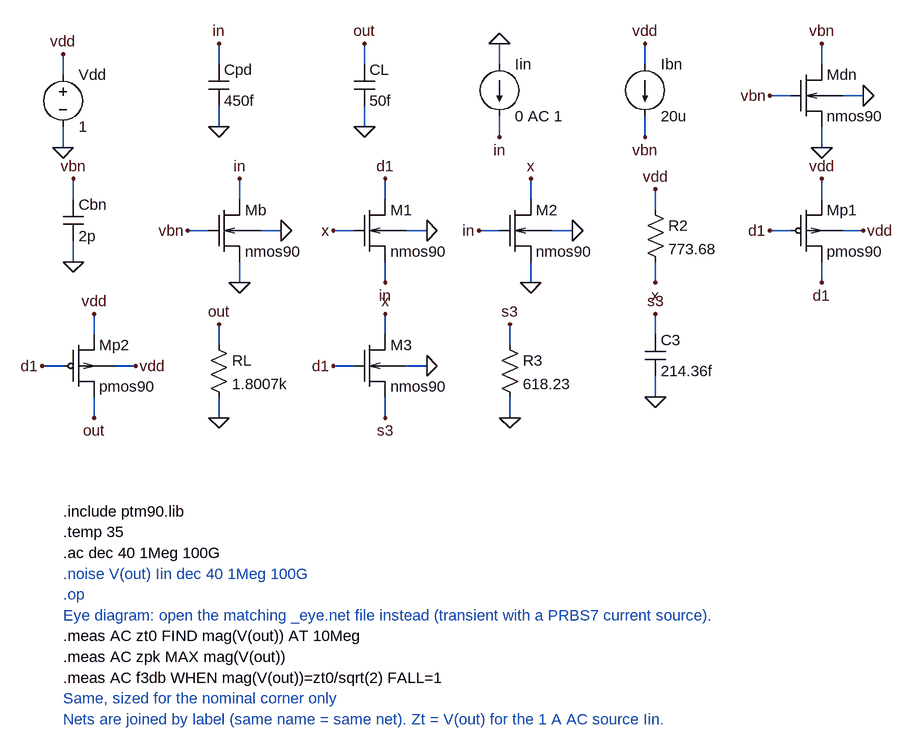
[diagram p0: schematic var_cmnrc_nominal.asc]
var_cmnrc_nominal.asc, the LTspice schematic file:
Version 4
SHEET 1 1600 1400
WIRE 0 16 0 -16
WIRE 0 96 0 128
WIRE 240 0 240 -32
WIRE 240 64 240 96
WIRE 464 0 464 -32
WIRE 464 64 464 96
WIRE 672 0 672 -32
WIRE 672 80 672 112
WIRE 896 0 896 -32
WIRE 896 80 896 112
WIRE 1168 0 1168 -32
WIRE 1120 48 1088 48
WIRE 1168 96 1168 128
WIRE 1200 48 1232 48
WIRE 16 208 16 176
WIRE 16 272 16 304
WIRE 272 208 272 176
WIRE 224 256 192 256
WIRE 272 304 272 336
WIRE 304 256 336 256
WIRE 496 208 496 176
WIRE 448 256 416 256
WIRE 496 304 496 336
WIRE 528 256 560 256
WIRE 720 208 720 176
WIRE 672 256 640 256
WIRE 720 304 720 336
WIRE 752 256 784 256
WIRE 912 224 912 192
WIRE 912 304 912 336
WIRE 1168 304 1168 336
WIRE 1120 256 1088 256
WIRE 1168 208 1168 176
WIRE 1200 256 1232 256
WIRE 48 512 48 544
WIRE 0 464 -32 464
WIRE 48 416 48 384
WIRE 80 464 112 464
WIRE 240 432 240 400
WIRE 240 512 240 544
WIRE 496 416 496 384
WIRE 448 464 416 464
WIRE 496 512 496 544
WIRE 528 464 560 464
WIRE 688 432 688 400
WIRE 688 512 688 544
WIRE 912 416 912 384
WIRE 912 480 912 512
FLAG 0 -16 vdd
FLAG 0 128 0
FLAG 240 -32 in
FLAG 240 96 0
FLAG 464 -32 out
FLAG 464 96 0
FLAG 672 -32 0
FLAG 672 112 in
FLAG 896 -32 vdd
FLAG 896 112 vbn
FLAG 1168 -32 vbn
FLAG 1088 48 vbn
FLAG 1168 128 0
FLAG 1232 48 0
FLAG 16 176 vbn
FLAG 16 304 0
FLAG 272 176 in
FLAG 192 256 vbn
FLAG 272 336 0
FLAG 336 256 0
FLAG 496 176 d1
FLAG 416 256 x
FLAG 496 336 in
FLAG 560 256 0
FLAG 720 176 x
FLAG 640 256 in
FLAG 720 336 0
FLAG 784 256 0
FLAG 912 192 vdd
FLAG 912 336 x
FLAG 1168 336 d1
FLAG 1088 256 d1
FLAG 1168 176 vdd
FLAG 1232 256 vdd
FLAG 48 544 out
FLAG -32 464 d1
FLAG 48 384 vdd
FLAG 112 464 vdd
FLAG 240 400 out
FLAG 240 544 0
FLAG 496 384 x
FLAG 416 464 d1
FLAG 496 544 s3
FLAG 560 464 0
FLAG 688 400 s3
FLAG 688 544 0
FLAG 912 384 s3
FLAG 912 512 0
SYMBOL voltage 0 0 R0
SYMATTR InstName Vdd
SYMATTR Value 1
SYMBOL cap 224 0 R0
SYMATTR InstName Cpd
SYMATTR Value 450f
SYMBOL cap 448 0 R0
SYMATTR InstName CL
SYMATTR Value 50f
SYMBOL current 672 0 R0
SYMATTR InstName Iin
SYMATTR Value 0 AC 1
SYMBOL current 896 0 R0
SYMATTR InstName Ibn
SYMATTR Value 20u
SYMBOL tia_nmos4 1120 0 R0
SYMATTR InstName Mdn
SYMATTR Value nmos90
SYMATTR Value2 l=200n w=1u ad=0.2p as=0.2p pd=2.4u ps=2.4u
SYMBOL cap 0 208 R0
SYMATTR InstName Cbn
SYMATTR Value 2p
SYMBOL tia_nmos4 224 208 R0
SYMATTR InstName Mb
SYMATTR Value nmos90
SYMATTR Value2 l=200n w=4.696u ad=0.9393p as=0.9393p pd=9.793u ps=9.793u
SYMBOL tia_nmos4 448 208 R0
SYMATTR InstName M1
SYMATTR Value nmos90
SYMATTR Value2 l=100n w=3.466u ad=0.6932p as=0.6932p pd=7.332u ps=7.332u
SYMBOL tia_nmos4 672 208 R0
SYMATTR InstName M2
SYMATTR Value nmos90
SYMATTR Value2 l=100n w=13.91u ad=2.782p as=2.782p pd=28.22u ps=28.22u
SYMBOL res 896 208 R0
SYMATTR InstName R2
SYMATTR Value 773.68
SYMBOL tia_pmos4 1120 208 R0
SYMATTR InstName Mp1
SYMATTR Value pmos90
SYMATTR Value2 l=100n w=2.981u ad=0.5962p as=0.5962p pd=6.362u ps=6.362u
SYMBOL tia_pmos4 0 416 R0
SYMATTR InstName Mp2
SYMATTR Value pmos90
SYMATTR Value2 l=100n w=12.66u ad=2.532p as=2.532p pd=25.72u ps=25.72u
SYMBOL res 224 416 R0
SYMATTR InstName RL
SYMATTR Value 1.8007k
SYMBOL tia_nmos4 448 416 R0
SYMATTR InstName M3
SYMATTR Value nmos90
SYMATTR Value2 l=100n w=3.391u ad=0.6783p as=0.6783p pd=7.183u ps=7.183u
SYMBOL res 672 416 R0
SYMATTR InstName R3
SYMATTR Value 618.23
SYMBOL cap 896 416 R0
SYMATTR InstName C3
SYMATTR Value 214.36f
TEXT 0 688 Left 2 !.include ptm90.lib
TEXT 0 720 Left 2 !.temp 35
TEXT 0 752 Left 2 !.ac dec 40 1Meg 100G
TEXT 0 784 Left 2 ;.noise V(out) Iin dec 40 1Meg 100G
TEXT 0 816 Left 2 ;.op
TEXT 0 848 Left 2 ;Eye diagram: open the matching _eye.net file instead (transient with a PRBS7 current source).
TEXT 0 880 Left 2 !.meas AC zt0 FIND mag(V(out)) AT 10Meg
TEXT 0 912 Left 2 !.meas AC zpk MAX mag(V(out))
TEXT 0 944 Left 2 !.meas AC f3db WHEN mag(V(out))=zt0/sqrt(2) FALL=1
TEXT 0 976 Left 2 ;Same, sized for the nominal corner only
TEXT 0 1008 Left 2 ;Nets are joined by label (same name = same net). Zt = V(out) for the 1 A AC source Iin.

The netlist it stands for:
* var_cmnrc_nominal.asc
Vdd vdd 0 1
Cpd in 0 450f
CL out 0 50f
Iin 0 in 0 AC 1
Ibn vdd vbn 20u
Mdn vbn vbn 0 0 nmos90 l=200n w=1u ad=0.2p as=0.2p pd=2.4u ps=2.4u
Cbn vbn 0 2p
Mb in vbn 0 0 nmos90 l=200n w=4.696u ad=0.9393p as=0.9393p pd=9.793u ps=9.793u
M1 d1 x in 0 nmos90 l=100n w=3.466u ad=0.6932p as=0.6932p pd=7.332u ps=7.332u
M2 x in 0 0 nmos90 l=100n w=13.91u ad=2.782p as=2.782p pd=28.22u ps=28.22u
R2 vdd x 773.68
Mp1 d1 d1 vdd vdd pmos90 l=100n w=2.981u ad=0.5962p as=0.5962p pd=6.362u ps=6.362u
Mp2 out d1 vdd vdd pmos90 l=100n w=12.66u ad=2.532p as=2.532p pd=25.72u ps=25.72u
RL out 0 1.8007k
M3 x d1 s3 0 nmos90 l=100n w=3.391u ad=0.6783p as=0.6783p pd=7.183u ps=7.183u
R3 s3 0 618.23
C3 s3 0 214.36f
.model NMOS NMOS
.model PMOS PMOS
.lib standard.mos
.include ptm90.lib
.temp 35
.ac dec 40 1Meg 100G
* .noise V(out) Iin dec 40 1Meg 100G
* .op
* Eye diagram: open the matching _eye.net file instead (transient with a PRBS7 current source).
.meas AC zt0 FIND mag(V(out)) AT 10Meg
.meas AC zpk MAX mag(V(out))
.meas AC f3db WHEN mag(V(out))=zt0/sqrt(2) FALL=1
* Same, sized for the nominal corner only
* Nets are joined by label (same name = same net). Zt = V(out) for the 1 A AC source Iin.
.backanno
.end